# Altium schematic sheet Top_Sheet.SchDoc: =Projectname
size A4; SheetNumber: 1; SheetTotal: 4
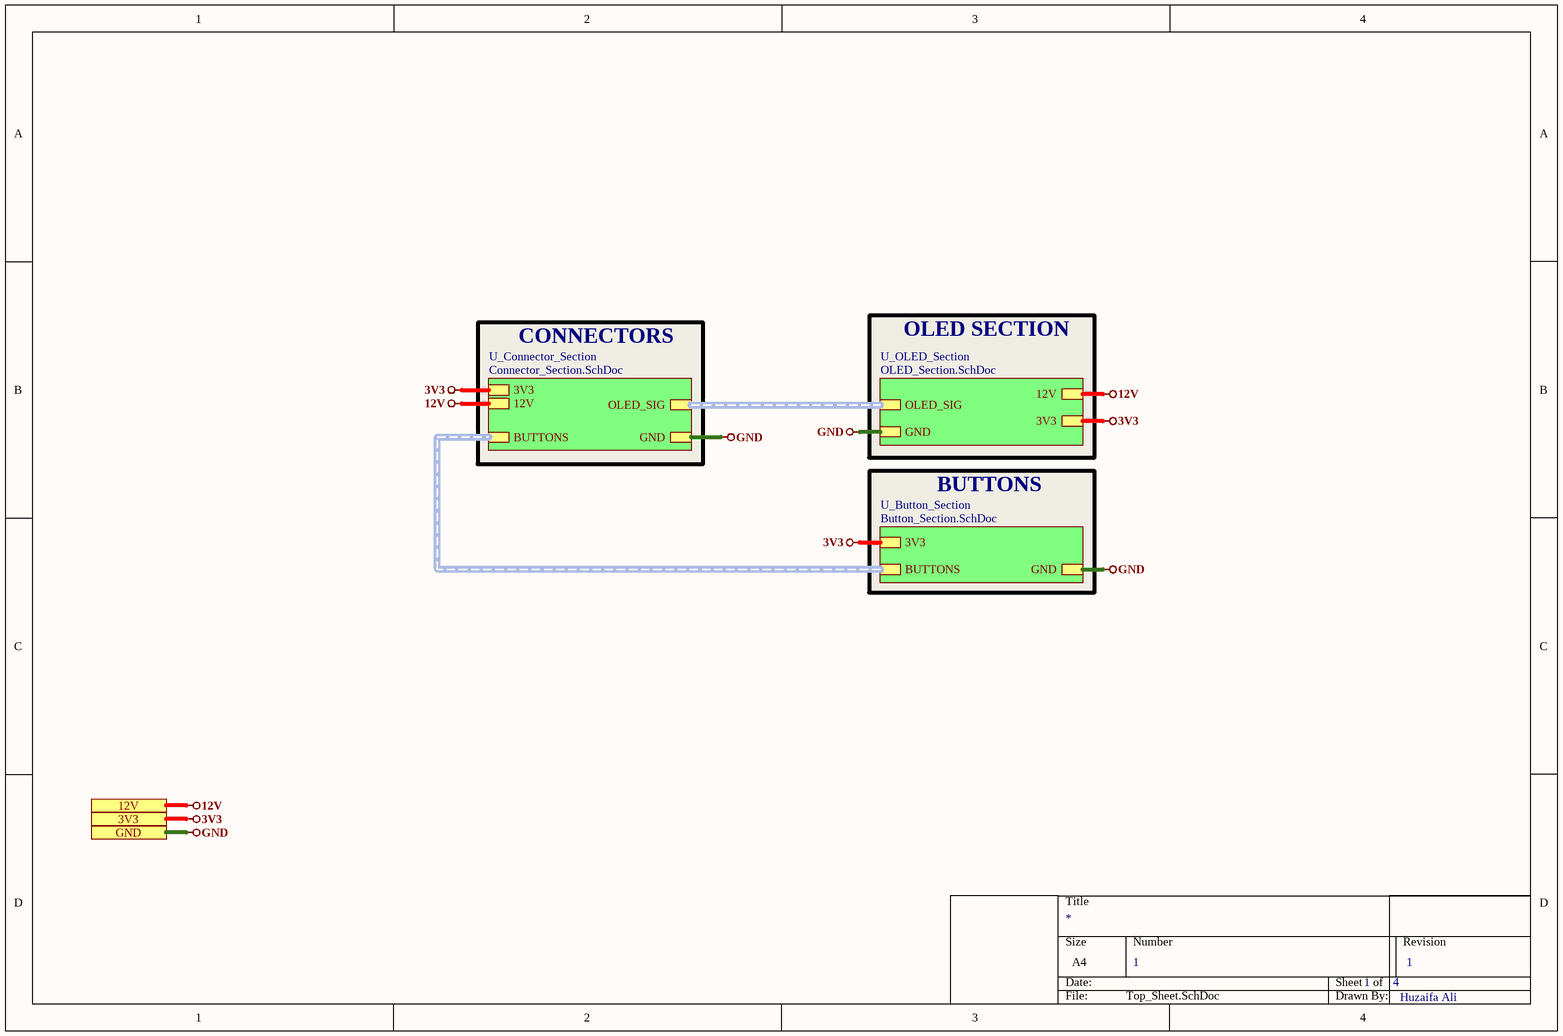
[diagram p0: Top_Sheet.SchDoc]

## Sub-sheets
U_Button_Section = Button_Section.SchDoc: BUTTONS (harness BUTTONS), 3V3, GND
U_Connector_Section = Connector_Section.SchDoc: OLED_SIG (harness OLED_SIG), BUTTONS (harness BUTTONS), 3V3, 12V, GND
U_OLED_Section = OLED_Section.SchDoc: 12V, 3V3, GND, OLED_SIG (harness OLED_SIG)

## Ports
3V3, 12V, GND

## Nets
3V3: port 3V3, sheet U_Connector_Section/3V3, sheet U_OLED_Section/3V3, sheet U_Button_Section/3V3
12V: port 12V, sheet U_Connector_Section/12V, sheet U_OLED_Section/12V
GND: port GND, sheet U_Connector_Section/GND, sheet U_OLED_Section/GND, sheet U_Button_Section/GND

## Buses and harness runs
harness sheet U_Button_Section/BUTTONS = sheet U_Connector_Section/BUTTONS
harness sheet U_Connector_Section/OLED_SIG = sheet U_OLED_Section/OLED_SIG

## Notes on the sheet
- CONNECTORS
- OLED SECTION
- BUTTONS
- 1
- Huzaifa Ali